# Altium schematic sheet XQG_MAIN2H.SchDoc
size 558 x 609 mm; SheetNumber: 0; SheetTotal: 0
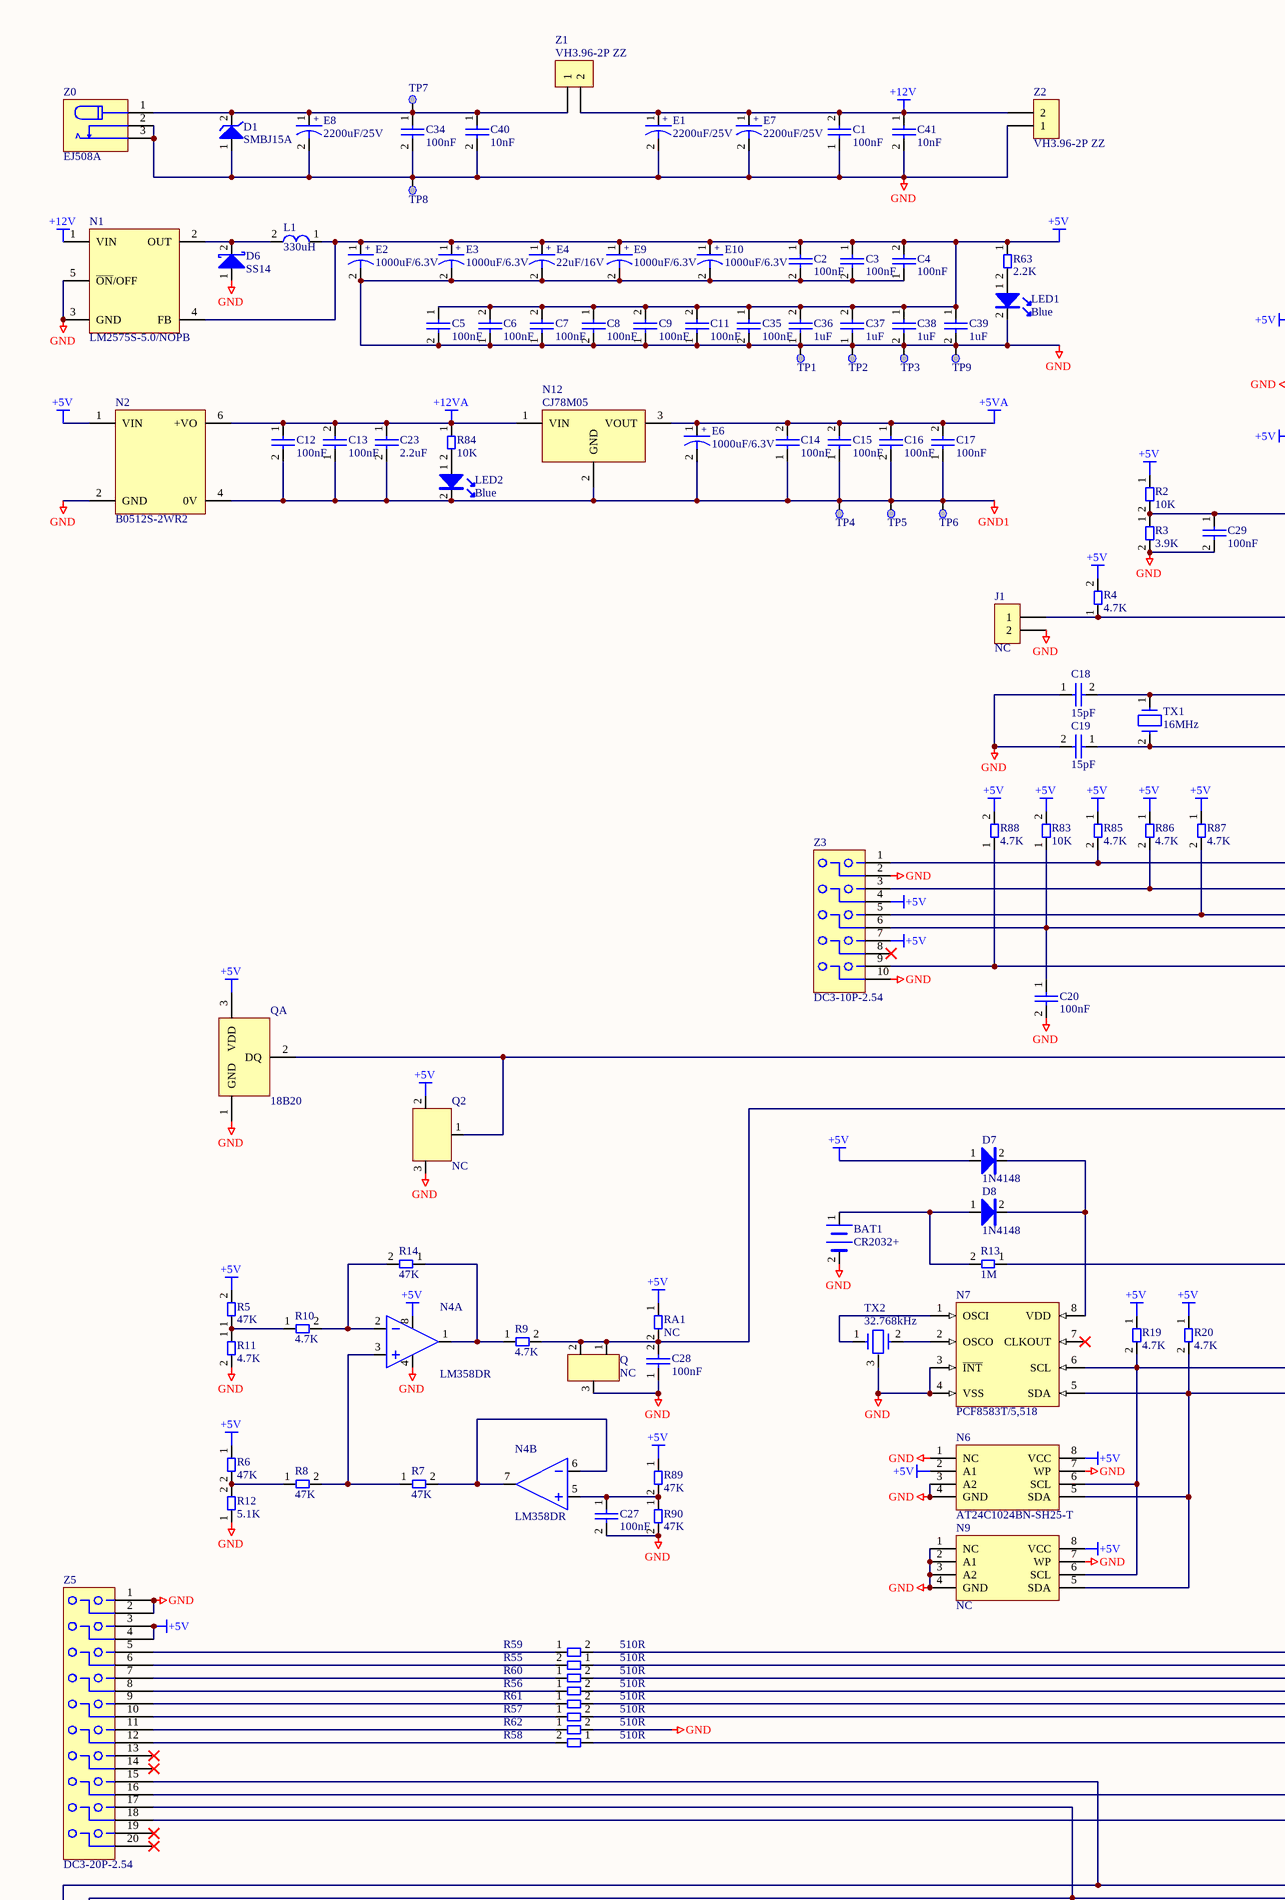
[diagram p0: XQG_MAIN2H.SchDoc, top left]
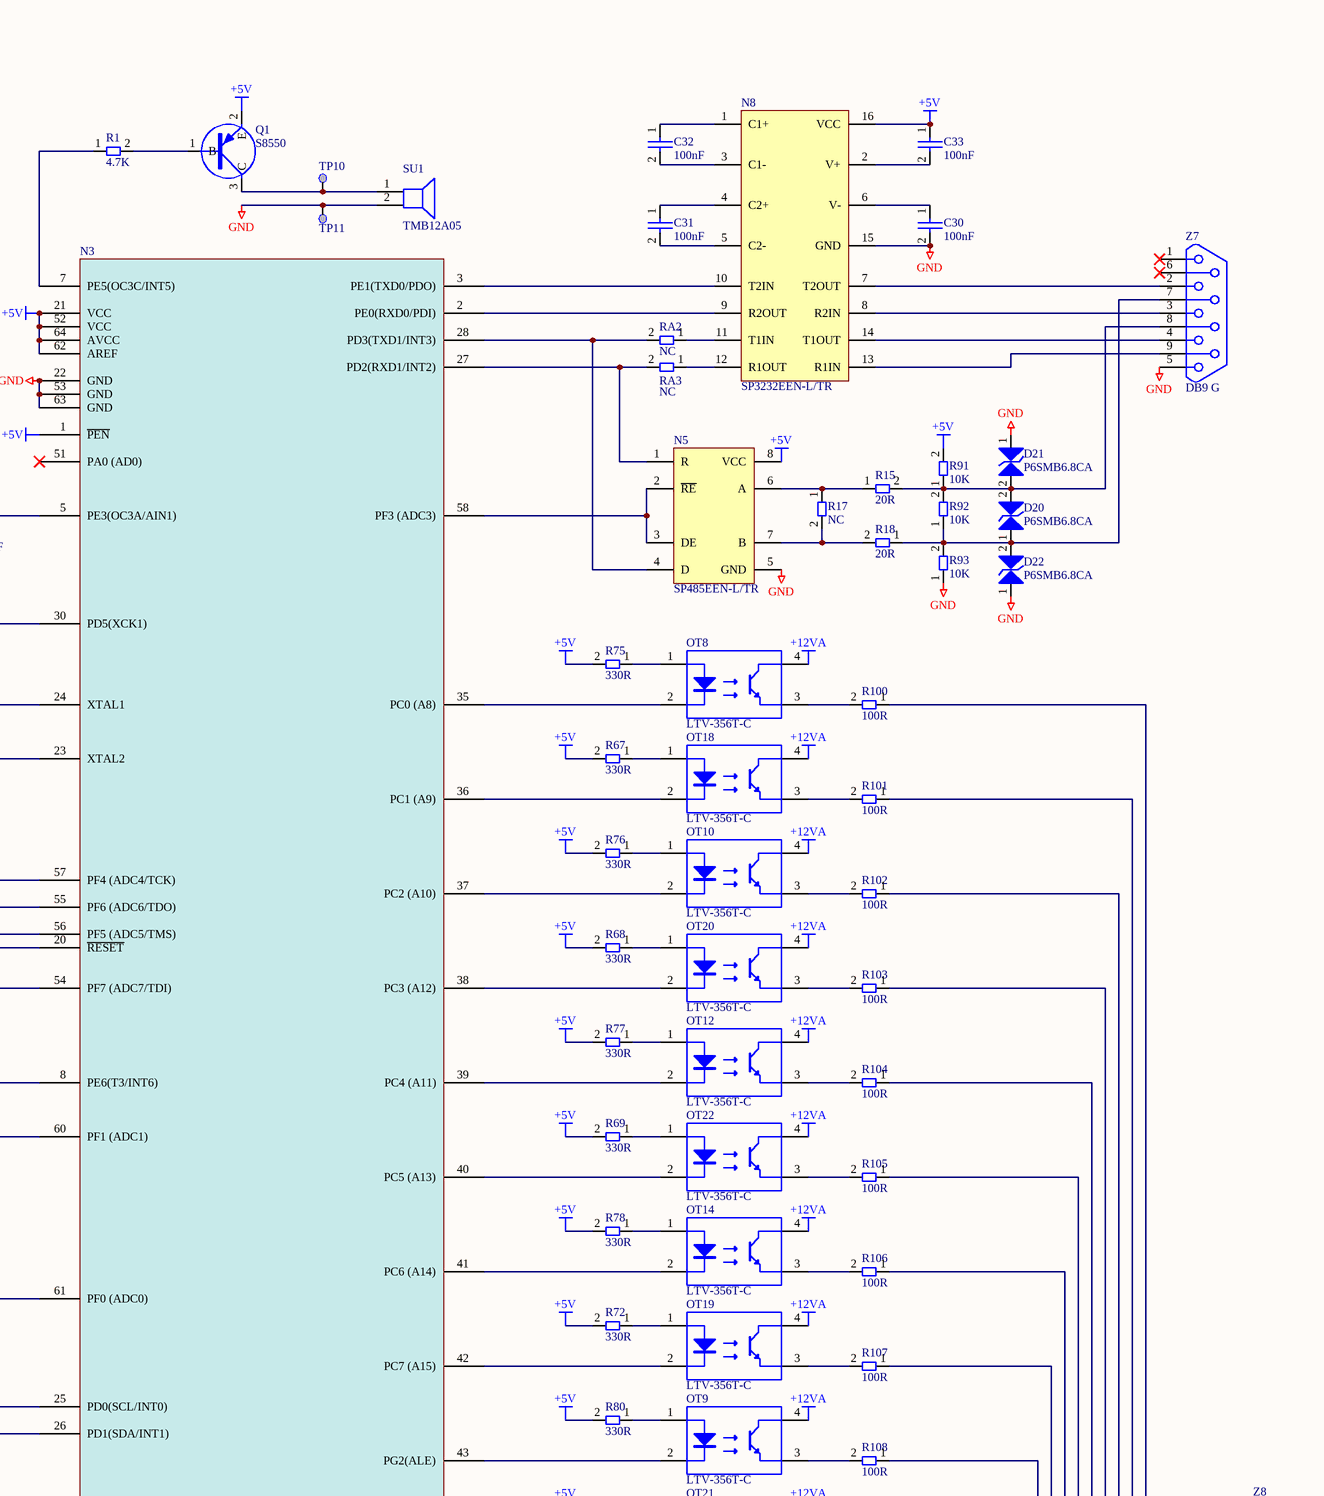
[diagram p1: XQG_MAIN2H.SchDoc, top right]
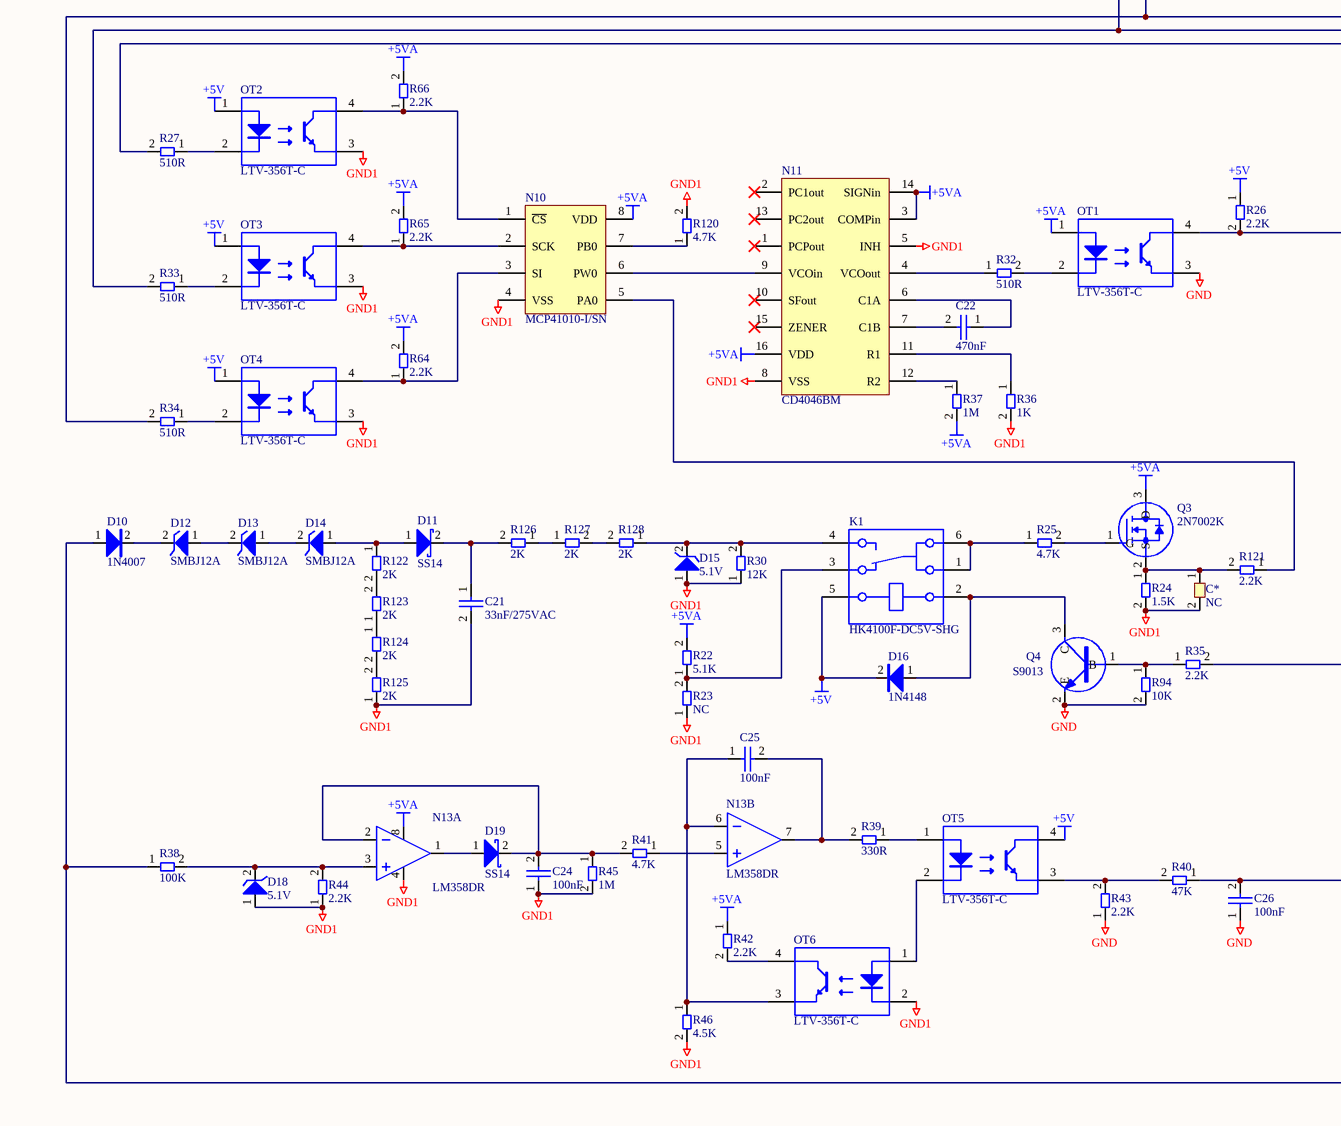
[diagram p2: XQG_MAIN2H.SchDoc, bottom left]
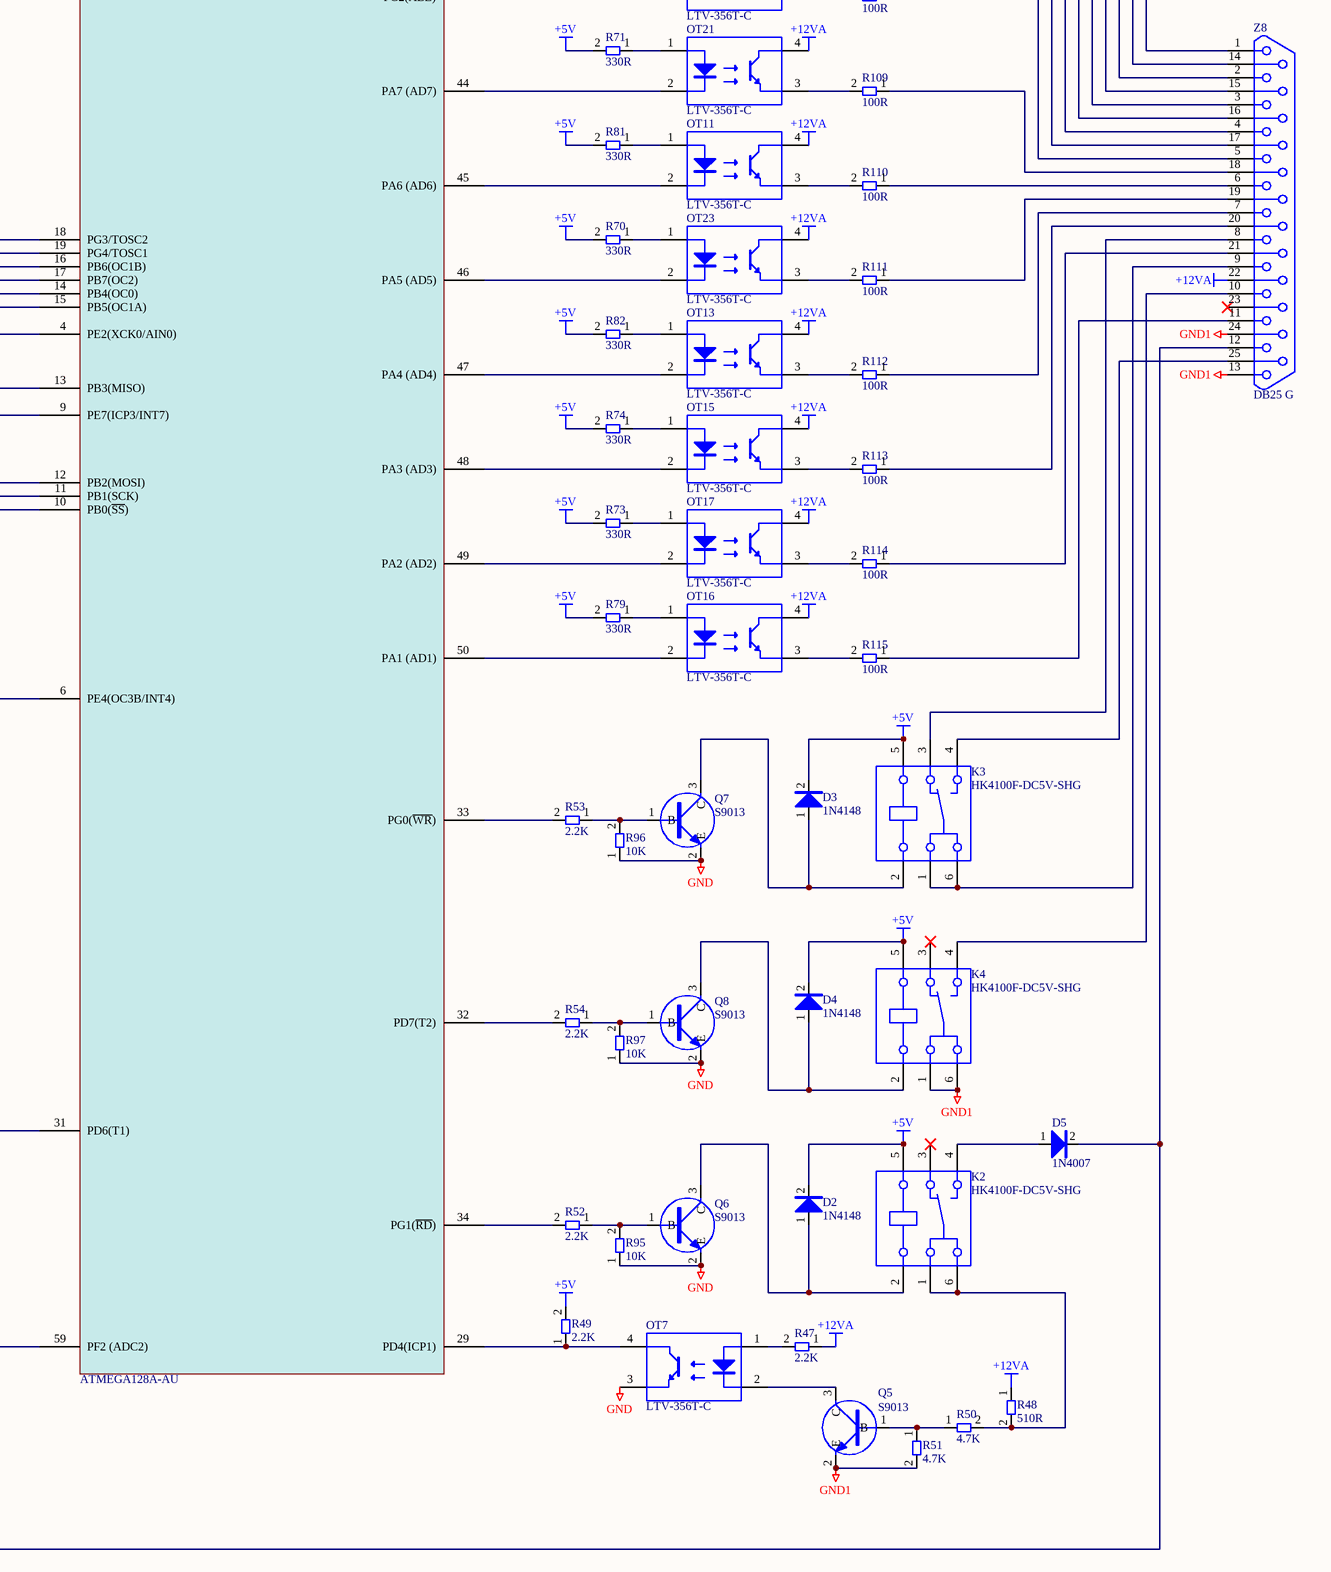
[diagram p3: XQG_MAIN2H.SchDoc, bottom right]

## Parts
BAT1  CR2032+  [BAT]
C1  100nF  [0603]
C2  100nF  [0603]
C3  100nF  [0603]
C4  100nF  [0603]
C5  100nF  [0603]
C6  100nF  [0603]
C7  100nF  [0603]
C8  100nF  [0603]
C9  100nF  [0603]
C11  100nF  [0603]
C12  100nF  [0603]
C13  100nF  [0603]
C14  100nF  [0603]
C15  100nF  [0603]
C16  100nF  [0603]
C17  100nF  [0603]
C18  15pF  [0603]
C19  15pF  [0603]
C20  100nF  [0603]
C21  33nF/275VAC  [C]
C22  470nF  [0603]
C23  2.2uF  [0805]
C24  100nF  [0603]
C25  100nF  [0603]
C26  100nF  [0603]
C27  100nF  [0603]
C28  100nF  [0603]
C29  100nF  [0603]
C30  100nF  [0603]
C31  100nF  [0603]
C32  100nF  [0603]
C33  100nF  [0603]
C34  100nF  [0603]
C35  100nF  [0603]
C36  1uF  [0603]
C37  1uF  [0603]
C38  1uF  [0603]
C39  1uF  [0603]
C40  10nF  [0603]
C41  10nF  [0603]
C*  NC  [0603]
D1  SMBJ15A  [SMB]
D2  1N4148  [SOD123]
D3  1N4148  [SOD123]
D4  1N4148  [SOD123]
D5  1N4007  [SMA]
D6  SS14  [SMA]
D7  1N4148  [SOD123]
D8  1N4148  [SOD123]
D10  1N4007  [SMA]
D11  SS14  [SMA]
D12  SMBJ12A  [SMB]
D13  SMBJ12A  [SMB]
D14  SMBJ12A  [SMB]
D15  5.1V  [SOD123]
D16  1N4148  [SOD123]
D18  5.1V  [SOD123]
D19  SS14  [SMA]
D20  P6SMB6.8CA  [SMB]
D21  P6SMB6.8CA  [SMB]
D22  P6SMB6.8CA  [SMB]
E1  2200uF/25V  [EC13]
E2  1000uF/6.3V  [EC8]
E3  1000uF/6.3V  [EC8]
E4  22uF/16V  [EC5]
E6  1000uF/6.3V  [EC8]
E7  2200uF/25V  [EC13]
E8  2200uF/25V  [EC13]
E9  1000uF/6.3V  [EC8]
E10  1000uF/6.3V  [EC8]
J1  NC  [TP]
K1  HK4100F-DC5V-SHG  [K]
K2  HK4100F-DC5V-SHG  [K]
K3  HK4100F-DC5V-SHG  [K]
K4  HK4100F-DC5V-SHG  [K]
L1  330uH  [L]
LED1  Blue  [LED0805]
LED2  Blue  [LED0805]
N1  LM2575S-5.0/NOPB  [TO-263]
N2  B0512S-2WR2  [DIP8]
N3  ATMEGA128A-AU  [QFP64]
N4  LM358DR  [SOP8]  (parts A,B of 2)
N5  SP485EEN-L/TR  [SOP8]
N6  AT24C1024BN-SH25-T  [SOP8]
N7  PCF8583T/5,518  [SOP-8]
N8  SP3232EEN-L/TR  [SOP16]
N9  NC  [SOP8]
N10  MCP41010-I/SN  [SOP8]
N11  CD4046BM  [SOP16]
N12  CJ78M05  [TO-263-3]
N13  LM358DR  [SOP8]  (parts A,B of 2)
OT1  LTV-356T-C  [SOP4]
OT2  LTV-356T-C  [SOP4]
OT3  LTV-356T-C  [SOP4]
OT4  LTV-356T-C  [SOP4]
OT5  LTV-356T-C  [SOP4]
OT6  LTV-356T-C  [SOP4]
OT7  LTV-356T-C  [SOP4]
OT8  LTV-356T-C  [SOP4]
OT9  LTV-356T-C  [SOP4]
OT10  LTV-356T-C  [SOP4]
OT11  LTV-356T-C  [SOP4]
OT12  LTV-356T-C  [SOP4]
OT13  LTV-356T-C  [SOP4]
OT14  LTV-356T-C  [SOP4]
OT15  LTV-356T-C  [SOP4]
OT16  LTV-356T-C  [SOP4]
OT17  LTV-356T-C  [SOP4]
OT18  LTV-356T-C  [SOP4]
OT19  LTV-356T-C  [SOP4]
OT20  LTV-356T-C  [SOP4]
OT21  LTV-356T-C  [SOP4]
OT22  LTV-356T-C  [SOP4]
OT23  LTV-356T-C  [SOP4]
Q  NC  [SOT23-3]
Q1  S8550  [SOT23]
Q2  NC  [SOT23]
Q3  2N7002K  [SOT23]
Q4  S9013  [SOT23]
Q5  S9013  [SOT23]
Q6  S9013  [SOT23]
Q7  S9013  [SOT23]
Q8  S9013  [SOT23]
QA  18B20  [TO-92]
R1  4.7K  [0603]
R2  10K  [0603]
R3  3.9K  [0603]
R4  4.7K  [0603]
R5  47K  [0603]
R6  47K  [0603]
R7  47K  [0603]
R8  47K  [0603]
R9  4.7K  [0603]
R10  4.7K  [0603]
R11  4.7K  [0603]
R12  5.1K  [0603]
R13  1M  [0603]
R14  47K  [0603]
R15  20R  [0603]
R17  NC  [0603]
R18  20R  [0603]
R19  4.7K  [0603]
R20  4.7K  [0603]
R22  5.1K  [0603]
R23  NC  [0603]
R24  1.5K  [0603]
R25  4.7K  [0603]
R26  2.2K  [0603]
R27  510R  [0603]
R30  12K  [1812]
R32  510R  [0603]
R33  510R  [0603]
R34  510R  [0603]
R35  2.2K  [0603]
R36  1K  [0603]
R37  1M  [0603]
R38  100K  [0603]
R39  330R  [0603]
R40  47K  [0603]
R41  4.7K  [0603]
R42  2.2K  [0603]
R43  2.2K  [0603]
R44  2.2K  [0603]
R45  1M  [0603]
R46  4.5K  [0603]
R47  2.2K  [0603]
R48  510R  [0603]
R49  2.2K  [0603]
R50  4.7K  [0603]
R51  4.7K  [0603]
R52  2.2K  [0603]
R53  2.2K  [0603]
R54  2.2K  [0603]
R55  510R  [0603]
R56  510R  [0603]
R57  510R  [0603]
R58  510R  [0603]
R59  510R  [0603]
R60  510R  [0603]
R61  510R  [0603]
R62  510R  [0603]
R63  2.2K  [0603]
R64  2.2K  [0603]
R65  2.2K  [0603]
R66  2.2K  [0603]
R67  330R  [0603]
R68  330R  [0603]
R69  330R  [0603]
R70  330R  [0603]
R71  330R  [0603]
R72  330R  [0603]
R73  330R  [0603]
R74  330R  [0603]
R75  330R  [0603]
R76  330R  [0603]
R77  330R  [0603]
R78  330R  [0603]
R79  330R  [0603]
R80  330R  [0603]
R81  330R  [0603]
R82  330R  [0603]
R83  10K  [0603]
R84  10K  [0603]
R85  4.7K  [0603]
R86  4.7K  [0603]
R87  4.7K  [0603]
R88  4.7K  [0603]
R89  47K  [0603]
R90  47K  [0603]
R91  10K  [0603]
R92  10K  [0603]
R93  10K  [0603]
R94  10K  [0603]
R95  10K  [0603]
R96  10K  [0603]
R97  10K  [0603]
R100  100R  [0603]
R101  100R  [0603]
R102  100R  [0603]
R103  100R  [0603]
R104  100R  [0603]
R105  100R  [0603]
R106  100R  [0603]
R107  100R  [0603]
R108  100R  [0603]
R109  100R  [0603]
R110  100R  [0603]
R111  100R  [0603]
R112  100R  [0603]
R113  100R  [0603]
R114  100R  [0603]
R115  100R  [0603]
R120  4.7K  [0603]
R121  2.2K  [0603]
R122  2K  [1812]
R123  2K  [1812]
R124  2K  [1812]
R125  2K  [1812]
R126  2K  [1812]
R127  2K  [1812]
R128  2K  [1812]
RA1  NC  [0603A]
RA2  NC  [0603]
RA3  NC  [0603]
SU1  TMB12A05  [RS]
TP1  (no value)  [TP1]
TP2  (no value)  [TP1]
TP3  (no value)  [TP1]
TP4  (no value)  [TP1]
TP5  (no value)  [TP1]
TP6  (no value)  [TP1]
TP7  (no value)  [TP1]
TP8  (no value)  [TP1]
TP9  (no value)  [TP1]
TP10  (no value)  [TP1]
TP11  (no value)  [TP1]
TX1  16MHz  [X]
TX2  32.768kHz  [X1]
Z0  EJ508A  [DC]
Z1  VH3.96-2P ZZ  [3.96X2P]
Z2  VH3.96-2P ZZ  [3.96X2P]
Z3  DC3-10P-2.54  [DIP2X5]
Z5  DC3-20P-2.54  [DIP2X10]
Z7  DB9 G  [DIP9]
Z8  DB25 G  [DIP25]

## Nets
+5V: C2.1 C3.1 C4.2 C5.1 C6.2 C7.2 C8.1 C9.2 C11.2 C33.1 C35.1 C36.2 C37.2 C38.1 C39.1 D2.2(K) D3.2(K) D4.2(K) D7.1(A) D16.2(K) E2.1 E3.1 E4.1 E9.1 E10.1 K1.5 K2.5 K3.5 K4.5 L1.1 N1.4(FB) N2.1(VIN) N3.1(~{PEN}) N3.21(VCC) N3.52(VCC) N3.62(AREF) N3.64(AVCC) N4.8(V+) N5.8(VCC) N6.2(A1) N6.8(VCC) N8.16(VCC) N9.8(VCC) OT2.1(A) OT3.1(A) OT4.1(A) OT5.4 Q1.2(E) Q2.2 QA.3(VDD) R2.1 R4.2 R5.2 R6.1 R19.1 R20.1 R26.1 R49.2 R63.1 R67.2 R68.2 R69.2 R70.2 R71.2 R72.2 R73.2 R74.2 R75.2 R76.2 R77.2 R78.2 R79.2 R80.2 R81.2 R82.2 R83.2 R85.1 R86.1 R87.1 R88.2 R89.1 R91.2 RA1.1 Z3.4 Z3.7 Z5.3 Z5.4
+5VA: C14.2 C15.2 C16.1 C17.2 E6.1 N10.8(VDD) N11.3(COMPin) N11.14(SIGNin) N11.16(VDD) N12.3(VOUT) N13.8(V+) OT1.1(A) Q3.3(D) R22.2 R37.2 R42.1 R64.2 R65.2 R66.2
+12V: C1.2 C41.1 E1.1 E7.1 N1.1(VIN) Z1.2 Z2.2
+12VA: C12.1 C13.2 C23.1 N2.6(+VO) N12.1(VIN) OT8.4 OT9.4 OT10.4 OT11.4 OT12.4 OT13.4 OT14.4 OT15.4 OT16.4 OT17.4 OT18.4 OT19.4 OT20.4 OT21.4 OT22.4 OT23.4 R47.1 R48.1 R84.1 Z8.22
GND: BAT1.2(-) C1.1 C2.2 C3.2 C4.1 C5.2 C6.1 C7.1 C8.2 C9.1 C11.1 C18.1 C19.2 C20.2 C26.1 C27.2 C28.1 C29.2 C30.2 C34.2 C35.2 C36.1 C37.1 C38.2 C39.2 C40.2 C41.2 D1.1(A) D6.1(A) D21.1(A) D22.1(A) E1.2 E2.2 E3.2 E4.2 E7.2 E8.2 E9.2 E10.2 J1.2 LED1.2(K) N1.3(GND) N1.5(~{ON}/OFF) N2.2(GND) N3.22(GND) N3.53(GND) N3.63(GND) N4.4(V-) N5.5(GND) N6.1(NC) N6.3(A2) N6.4(GND) N6.7(WP) N7.3(~{INT}) N7.4(VSS) N8.15(GND) N9.1(NC) N9.2(A1) N9.3(A2) N9.4(GND) N9.7(WP) OT1.3 OT7.3 Q.3 Q2.3 Q4.2(E) Q6.2(E) Q7.2(E) Q8.2(E) QA.1(GND) R3.2 R11.2 R12.1 R43.1 R62.2 R90.2 R93.1 R94.2 R95.1 R96.1 R97.1 SU1.2 TP1.1 TP2.1 TP3.1 TP8.1 TP9.1 TP11.1 TX2.3 Z0.2 Z0.3 Z2.1 Z3.2 Z3.10 Z5.1 Z5.2 Z7.5
GND1: C12.2 C13.1 C14.1 C15.1 C16.2 C17.1 C21.2 C23.2 C24.1 C*.2 D15.1(A) D18.1(A) E6.2 K4.1 K4.6 LED2.2(K) N2.4(0V) N10.4(VSS) N11.5(INH) N11.8(VSS) N12.2(GND) N13.4(V-) OT2.3 OT3.3 OT4.3 OT6.2(K) Q5.2(E) R23.1 R24.2 R30.1 R36.2 R44.1 R45.2 R46.2 R51.2 R120.2 R125.1 TP4.1 TP5.1 TP6.1 Z8.13 Z8.24
NetBAT1_1: BAT1.1(+) D8.1(A) R13.2
NetC18_2: C18.2 N3.24(XTAL1) TX1.1
NetC19_1: C19.1 N3.23(XTAL2) TX1.2
NetC20_1: C20.1 N3.20(~{RESET}) R83.1 Z3.6
NetC21_1: C21.1 D11.2(K) R126.2
NetC22_1: C22.1 N11.6(C1A)
NetC22_2: C22.2 N11.7(C1B)
NetC24_2: C24.2 D19.2(K) N13.2(IN-) R41.2 R45.1
NetC25_1: C25.1 N13.6(IN-) OT6.3 R46.1
NetC25_2: C25.2 N13.7(OUT) R39.2
NetC26_2: C26.2 N3.59(PF2_(ADC2)) R40.1
NetC27_1: C27.1 N4.5(IN+) R89.2 R90.1
NetC28_2: C28.2 N3.60(PF1_(ADC1)) Q.1 Q.2 R9.2 RA1.2
NetC29_1: C29.1 N3.5(PE3(OC3A/AIN1)) R2.2 R3.1
NetC30_1: C30.1 N8.6(V-)
NetC31_1: C31.1 N8.4(C2+)
NetC31_2: C31.2 N8.5(C2-)
NetC32_1: C32.1 N8.1(C1+)
NetC32_2: C32.2 N8.3(C1-)
NetC33_2: C33.2 N8.2(V+)
NetC34_1: C34.1 C40.1 D1.2(K) E8.1 TP7.1 Z0.1 Z1.1
NetC*_1: C*.1 Q3.2(S) R24.1 R121.2
NetD2_1: D2.1(A) K2.2 Q6.3(C)
NetD3_1: D3.1(A) K3.2 Q7.3(C)
NetD4_1: D4.1(A) K4.2 Q8.3(C)
NetD5_1: D5.1(A) K2.4
NetD5_2: D5.2(K) D10.1(A) R38.1 Z8.12
NetD6_2: D6.2(K) L1.2 N1.2(OUT)
NetD7_2: D7.2(K) D8.2(K) N7.8(VDD)
NetD10_2: D10.2(K) D12.2(K)
NetD11_1: D11.1(A) D14.1(A) R122.1
NetD12_1: D12.1(A) D13.2(K)
NetD13_1: D13.1(A) D14.2(K)
NetD15_2: D15.2(K) K1.4 R30.2 R128.1
NetD16_1: D16.1(A) K1.2 Q4.3(C)
NetD18_2: D18.2(K) N13.3(IN+) R38.2 R44.2
NetD19_1: D19.1(A) N13.1(OUT)
NetD20_1: D20.1(A) D22.2(K) R18.1 R92.1 R93.2 Z7.7
NetD20_2: D20.2(K) D21.2(K) R15.2 R91.1 R92.2 Z7.8
NetJ1_1: J1.1 N3.30(PD5(XCK1)) R4.1
NetK1_1: K1.1 K1.6 R25.1
NetK1_3: K1.3 R22.1 R23.2
NetK2_1: K2.1 K2.6 R48.2 R50.2
NetK3_1: K3.1 K3.6 Z8.9
NetK3_3: K3.3 Z8.8
NetK3_4: K3.4 Z8.25
NetK4_4: K4.4 Z8.10
NetLED1_1: LED1.1(A) R63.2
NetLED2_1: LED2.1(A) R84.2
NetN3_2: N3.2(PE0(RXD0/PDI)) N8.9(R2OUT)
NetN3_3: N3.3(PE1(TXD0/PDO)) N8.10(T2IN)
NetN3_4: N3.4(PE2(XCK0/AIN0)) R58.1
NetN3_6: N3.6(PE4(OC3B/INT4)) OT1.4 R26.2
NetN3_7: N3.7(PE5(OC3C/INT5)) R1.1
NetN3_8: N3.8(PE6(T3/INT6)) Q2.1 QA.2(DQ)
NetN3_9: N3.9(PE7(ICP3/INT7)) Z5.18
NetN3_10: N3.10(PB0(~{SS})) R27.2
NetN3_11: N3.11(PB1(SCK)) R33.2 Z5.17
NetN3_12: N3.12(PB2(MOSI)) R34.2 Z5.15
NetN3_13: N3.13(PB3(MISO)) Z5.16
NetN3_14: N3.14(PB4(OC0)) R61.2
NetN3_15: N3.15(PB5(OC1A)) R57.2
NetN3_16: N3.16(PB6(OC1B)) R60.2
NetN3_17: N3.17(PB7(OC2)) R56.2
NetN3_18: N3.18(PG3/TOSC2) R59.2
NetN3_19: N3.19(PG4/TOSC1) R55.1
NetN3_25: N3.25(PD0(SCL/INT0)) N6.6(SCL) N7.6(SCL) N9.6(SCL) R19.2
NetN3_26: N3.26(PD1(SDA/INT1)) N6.5(SDA) N7.5(SDA) N9.5(SDA) R20.2
NetN3_27: N3.27(PD2(RXD1/INT2)) N5.1(R) RA3.2
NetN3_28: N3.28(PD3(TXD1/INT3)) N5.4(D) RA2.2
NetN3_29: N3.29(PD4(ICP1)) OT7.4 R49.1
NetN3_31: N3.31(PD6(T1)) R35.2
NetN3_32: N3.32(PD7(T2)) R54.2
NetN3_33: N3.33(PG0(~{WR})) R53.2
NetN3_34: N3.34(PG1(~{RD})) R52.2
NetN3_35: N3.35(PC0_(A8)) OT8.2(K)
NetN3_36: N3.36(PC1_(A9)) OT18.2(K)
NetN3_37: N3.37(PC2_(A10)) OT10.2(K)
NetN3_38: N3.38(PC3_(A12)) OT20.2(K)
NetN3_39: N3.39(PC4_(A11)) OT12.2(K)
NetN3_40: N3.40(PC5_(A13)) OT22.2(K)
NetN3_41: N3.41(PC6_(A14)) OT14.2(K)
NetN3_42: N3.42(PC7_(A15)) OT19.2(K)
NetN3_43: N3.43(PG2(ALE)) OT9.2(K)
NetN3_44: N3.44(PA7_(AD7)) OT21.2(K)
NetN3_45: N3.45(PA6_(AD6)) OT11.2(K)
NetN3_46: N3.46(PA5_(AD5)) OT23.2(K)
NetN3_47: N3.47(PA4_(AD4)) OT13.2(K)
NetN3_48: N3.48(PA3_(AD3)) OT15.2(K)
NetN3_49: N3.49(PA2_(AD2)) OT17.2(K)
NetN3_50: N3.50(PA1_(AD1)) OT16.2(K)
NetN3_54: N3.54(PF7_(ADC7/TDI)) R88.1 Z3.9
NetN3_55: N3.55(PF6_(ADC6/TDO)) R86.2 Z3.3
NetN3_56: N3.56(PF5_(ADC5/TMS)) R87.2 Z3.5
NetN3_57: N3.57(PF4_(ADC4/TCK)) R85.2 Z3.1
NetN3_58: N3.58(PF3_(ADC3)) N5.2(~{RE}) N5.3(DE)
NetN3_61: N3.61(PF0_(ADC0)) R13.1
NetN4_1: N4.1(OUT) R9.1 R14.1
NetN4_2: N4.2(IN-) R10.2 R14.2
NetN4_3: N4.3(IN+) R7.1 R8.2
NetN4_6: N4.6(IN-) N4.7(OUT) R7.2
NetN5_6: N5.6(A) R15.1 R17.1
NetN5_7: N5.7(B) R17.2 R18.2
NetN7_1: N7.1(OSCI) TX2.1
NetN7_2: N7.2(OSCO) TX2.2
NetN8_7: N8.7(T2OUT) Z7.2
NetN8_8: N8.8(R2IN) Z7.3
NetN8_11: N8.11(T1IN) RA2.1
NetN8_12: N8.12(R1OUT) RA3.1
NetN8_13: N8.13(R1IN) Z7.9
NetN8_14: N8.14(T1OUT) Z7.4
NetN10_1: N10.1(~{CS}) OT2.4 R66.1
NetN10_2: N10.2(SCK) OT3.4 R65.1
NetN10_3: N10.3(SI) OT4.4 R64.1
NetN10_5: N10.5(PA0) R121.1
NetN10_6: N10.6(PW0) N11.9(VCOin)
NetN10_7: N10.7(PB0) R120.1
NetN11_4: N11.4(VCOout) R32.1
NetN11_11: N11.11(R1) R36.1
NetN11_12: N11.12(R2) R37.1
NetN13_5: N13.5(IN+) R41.1
NetOT1_2: OT1.2(K) R32.2
NetOT2_2: OT2.2(K) R27.1
NetOT3_2: OT3.2(K) R33.1
NetOT4_2: OT4.2(K) R34.1
NetOT5_1: OT5.1(A) R39.1
NetOT5_2: OT5.2(K) OT6.1(A)
NetOT5_3: OT5.3 R40.2 R43.2
NetOT6_4: OT6.4 R42.2
NetOT7_1: OT7.1(A) R47.2
NetOT7_2: OT7.2(K) Q5.3(C)
NetOT8_1: OT8.1(A) R75.1
NetOT8_3: OT8.3 R100.2
NetOT9_1: OT9.1(A) R80.1
NetOT9_3: OT9.3 R108.2
NetOT10_1: OT10.1(A) R76.1
NetOT10_3: OT10.3 R102.2
NetOT11_1: OT11.1(A) R81.1
NetOT11_3: OT11.3 R110.2
NetOT12_1: OT12.1(A) R77.1
NetOT12_3: OT12.3 R104.2
NetOT13_1: OT13.1(A) R82.1
NetOT13_3: OT13.3 R112.2
NetOT14_1: OT14.1(A) R78.1
NetOT14_3: OT14.3 R106.2
NetOT15_1: OT15.1(A) R74.1
NetOT15_3: OT15.3 R113.2
NetOT16_1: OT16.1(A) R79.1
NetOT16_3: OT16.3 R115.2
NetOT17_1: OT17.1(A) R73.1
NetOT17_3: OT17.3 R114.2
NetOT18_1: OT18.1(A) R67.1
NetOT18_3: OT18.3 R101.2
NetOT19_1: OT19.1(A) R72.1
NetOT19_3: OT19.3 R107.2
NetOT20_1: OT20.1(A) R68.1
NetOT20_3: OT20.3 R103.2
NetOT21_1: OT21.1(A) R71.1
NetOT21_3: OT21.3 R109.2
NetOT22_1: OT22.1(A) R69.1
NetOT22_3: OT22.3 R105.2
NetOT23_1: OT23.1(A) R70.1
NetOT23_3: OT23.3 R111.2
NetQ1_1: Q1.1(B) R1.2
NetQ1_3: Q1.3(C) SU1.1 TP10.1
NetQ3_1: Q3.1(G) R25.2
NetQ4_1: Q4.1(B) R35.1 R94.1
NetQ5_1: Q5.1(B) R50.1 R51.1
NetQ6_1: Q6.1(B) R52.1 R95.2
NetQ7_1: Q7.1(B) R53.1 R96.2
NetQ8_1: Q8.1(B) R54.1 R97.2
NetR5_1: R5.1 R10.1 R11.1
NetR6_2: R6.2 R8.1 R12.2
NetR55_2: R55.2 Z5.6
NetR56_1: R56.1 Z5.8
NetR57_1: R57.1 Z5.10
NetR58_2: R58.2 Z5.12
NetR59_1: R59.1 Z5.5
NetR60_1: R60.1 Z5.7
NetR61_1: R61.1 Z5.9
NetR62_1: R62.1 Z5.11
NetR100_1: R100.1 Z8.1
NetR101_1: R101.1 Z8.14
NetR102_1: R102.1 Z8.2
NetR103_1: R103.1 Z8.15
NetR104_1: R104.1 Z8.3
NetR105_1: R105.1 Z8.16
NetR106_1: R106.1 Z8.4
NetR107_1: R107.1 Z8.17
NetR108_1: R108.1 Z8.5
NetR109_1: R109.1 Z8.18
NetR110_1: R110.1 Z8.6
NetR111_1: R111.1 Z8.19
NetR112_1: R112.1 Z8.7
NetR113_1: R113.1 Z8.20
NetR114_1: R114.1 Z8.21
NetR115_1: R115.1 Z8.11
NetR122_2: R122.2 R123.2
NetR123_1: R123.1 R124.1
NetR124_2: R124.2 R125.2
NetR126_1: R126.1 R127.1
NetR127_2: R127.2 R128.2

Not connected (* = marked no-connect by the designer): K2 3*; K4 3*; N3 51(PA0_(AD0))*; N7 7(CLKOUT)*; N11 1(PCPout)* 2(PC1out)* 10(SFout)* 13(PC2out)* 15(ZENER)*; Z3 8*; Z5 13* 14* 19* 20*; Z7 1* 6*; Z8 23*

## Notes on the sheet
- (in symbol CAP1) +

## Library data of the parts
BAT1 = BATTERY
C1-C9 C11-C41 = CAP: Capacitor
D1 D12-D14 = TVS-U
D2-D5 D7 D8 D10 D16 = DIODE
D6 D11 D19 = DIODE S
D15 D18 = ZENER3: Zener Diode
D20-D22 = TVS-B
E1-E4 E6-E10 = CAP1
J1 Z1 Z2 = CON2: Connector
K1-K4 = RELAY7
L1 = IAD
LED1 LED2 = LED
N1 = LM2576S-5.0
N4 N13 = OPAMP2
N5 = MAX485CSA
N7 = PCF8563T
N8 = MAX3232EI
N9 = AT24C1024BN-SH25-T
N11 = HEF4046BT
N12 = VOLTREG
OT1-OT23 = OPTOISO1-1
Q = Q
Q1 = PNP-1B2E3C
Q2 = Q2
Q3 = N-MOS-1G2S3D
Q4-Q8 = NPN-1B2E3C
QA = DS18B20
R1-R15 R17-R20 R22-R27 R30 R32-R97 R100-R115 R120-R128 RA1-RA3 = RA-1
SU1 = SPEAKER
TP1-TP11 = TEST1
TX1 = CRYSTAL
TX2 = CRYSTAL2
Z0 = DC-005-A
Z3 = CONN10
Z5 = CONN20
Z7 = DB9
Z8 = DB25